# Altium schematic sheet Altium_Schematic.schdoc (part 4 of 6)
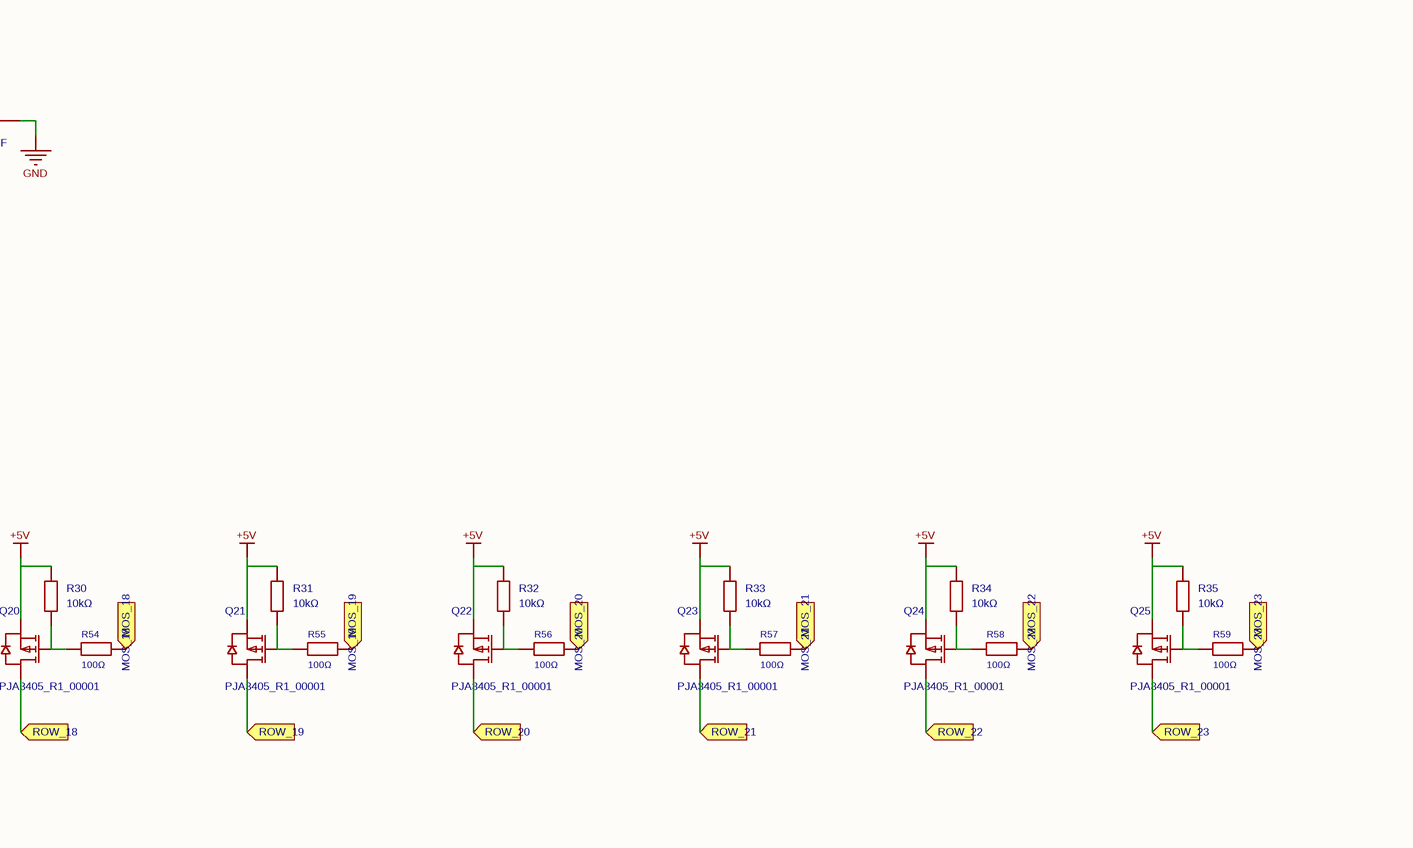
[diagram p14: Altium_Schematic.schdoc, bottom column 4 of 4]

## Parts (continued)
LED1572  16-213/BHC-AN1P2/3T  [LED0402-R-RD]  (value not drawn)
LED1573  16-213/BHC-AN1P2/3T  [LED0402-R-RD]  (value not drawn)
LED1574  16-213/BHC-AN1P2/3T  [LED0402-R-RD]  (value not drawn)
LED1575  16-213/BHC-AN1P2/3T  [LED0402-R-RD]  (value not drawn)
LED1576  16-213/BHC-AN1P2/3T  [LED0402-R-RD]  (value not drawn)
LED1577  16-213/BHC-AN1P2/3T  [LED0402-R-RD]  (value not drawn)
LED1578  16-213/BHC-AN1P2/3T  [LED0402-R-RD]  (value not drawn)
LED1579  16-213/BHC-AN1P2/3T  [LED0402-R-RD]  (value not drawn)
LED1580  16-213/BHC-AN1P2/3T  [LED0402-R-RD]  (value not drawn)
LED1581  16-213/BHC-AN1P2/3T  [LED0402-R-RD]  (value not drawn)
LED1582  16-213/BHC-AN1P2/3T  [LED0402-R-RD]  (value not drawn)
LED1583  16-213/BHC-AN1P2/3T  [LED0402-R-RD]  (value not drawn)
LED1584  16-213/BHC-AN1P2/3T  [LED0402-R-RD]  (value not drawn)
LED1585  16-213/BHC-AN1P2/3T  [LED0402-R-RD]  (value not drawn)
LED1586  16-213/BHC-AN1P2/3T  [LED0402-R-RD]  (value not drawn)
LED1587  16-213/BHC-AN1P2/3T  [LED0402-R-RD]  (value not drawn)
LED1588  16-213/BHC-AN1P2/3T  [LED0402-R-RD]  (value not drawn)
LED1589  16-213/BHC-AN1P2/3T  [LED0402-R-RD]  (value not drawn)
LED1590  16-213/BHC-AN1P2/3T  [LED0402-R-RD]  (value not drawn)
LED1591  16-213/BHC-AN1P2/3T  [LED0402-R-RD]  (value not drawn)
LED1592  16-213/BHC-AN1P2/3T  [LED0402-R-RD]  (value not drawn)
LED1593  16-213/BHC-AN1P2/3T  [LED0402-R-RD]  (value not drawn)
LED1594  16-213/BHC-AN1P2/3T  [LED0402-R-RD]  (value not drawn)
LED1595  16-213/BHC-AN1P2/3T  [LED0402-R-RD]  (value not drawn)
LED1596  16-213/BHC-AN1P2/3T  [LED0402-R-RD]  (value not drawn)
LED1597  16-213/BHC-AN1P2/3T  [LED0402-R-RD]  (value not drawn)
LED1598  16-213/BHC-AN1P2/3T  [LED0402-R-RD]  (value not drawn)
LED1599  16-213/BHC-AN1P2/3T  [LED0402-R-RD]  (value not drawn)
LED1600  16-213/BHC-AN1P2/3T  [LED0402-R-RD]  (value not drawn)
LED1601  16-213/BHC-AN1P2/3T  [LED0402-R-RD]  (value not drawn)
LED1602  16-213/BHC-AN1P2/3T  [LED0402-R-RD]  (value not drawn)
LED1603  16-213/BHC-AN1P2/3T  [LED0402-R-RD]  (value not drawn)
LED1604  16-213/BHC-AN1P2/3T  [LED0402-R-RD]  (value not drawn)
LED1605  16-213/BHC-AN1P2/3T  [LED0402-R-RD]  (value not drawn)
LED1606  16-213/BHC-AN1P2/3T  [LED0402-R-RD]  (value not drawn)
LED1607  16-213/BHC-AN1P2/3T  [LED0402-R-RD]  (value not drawn)
LED1608  16-213/BHC-AN1P2/3T  [LED0402-R-RD]  (value not drawn)
LED1609  16-213/BHC-AN1P2/3T  [LED0402-R-RD]  (value not drawn)
LED1610  16-213/BHC-AN1P2/3T  [LED0402-R-RD]  (value not drawn)
LED1611  16-213/BHC-AN1P2/3T  [LED0402-R-RD]  (value not drawn)
LED1612  16-213/BHC-AN1P2/3T  [LED0402-R-RD]  (value not drawn)
LED1613  16-213/BHC-AN1P2/3T  [LED0402-R-RD]  (value not drawn)
LED1614  16-213/BHC-AN1P2/3T  [LED0402-R-RD]  (value not drawn)
LED1615  16-213/BHC-AN1P2/3T  [LED0402-R-RD]  (value not drawn)
LED1616  16-213/BHC-AN1P2/3T  [LED0402-R-RD]  (value not drawn)
LED1617  16-213/BHC-AN1P2/3T  [LED0402-R-RD]  (value not drawn)
LED1618  16-213/BHC-AN1P2/3T  [LED0402-R-RD]  (value not drawn)
LED1619  16-213/BHC-AN1P2/3T  [LED0402-R-RD]  (value not drawn)
LED1620  16-213/BHC-AN1P2/3T  [LED0402-R-RD]  (value not drawn)
LED1621  16-213/BHC-AN1P2/3T  [LED0402-R-RD]  (value not drawn)
LED1622  16-213/BHC-AN1P2/3T  [LED0402-R-RD]  (value not drawn)
LED1623  16-213/BHC-AN1P2/3T  [LED0402-R-RD]  (value not drawn)
LED1624  16-213/BHC-AN1P2/3T  [LED0402-R-RD]  (value not drawn)
LED1625  16-213/BHC-AN1P2/3T  [LED0402-R-RD]  (value not drawn)
LED1626  16-213/BHC-AN1P2/3T  [LED0402-R-RD]  (value not drawn)
LED1627  16-213/BHC-AN1P2/3T  [LED0402-R-RD]  (value not drawn)
LED1628  16-213/BHC-AN1P2/3T  [LED0402-R-RD]  (value not drawn)
LED1629  16-213/BHC-AN1P2/3T  [LED0402-R-RD]  (value not drawn)
LED1630  16-213/BHC-AN1P2/3T  [LED0402-R-RD]  (value not drawn)
LED1631  16-213/BHC-AN1P2/3T  [LED0402-R-RD]  (value not drawn)
LED1632  16-213/BHC-AN1P2/3T  [LED0402-R-RD]  (value not drawn)
LED1633  16-213/BHC-AN1P2/3T  [LED0402-R-RD]  (value not drawn)
LED1634  16-213/BHC-AN1P2/3T  [LED0402-R-RD]  (value not drawn)
LED1635  16-213/BHC-AN1P2/3T  [LED0402-R-RD]  (value not drawn)
LED1636  16-213/BHC-AN1P2/3T  [LED0402-R-RD]  (value not drawn)
LED1637  16-213/BHC-AN1P2/3T  [LED0402-R-RD]  (value not drawn)
LED1638  16-213/BHC-AN1P2/3T  [LED0402-R-RD]  (value not drawn)
LED1639  16-213/BHC-AN1P2/3T  [LED0402-R-RD]  (value not drawn)
LED1640  16-213/BHC-AN1P2/3T  [LED0402-R-RD]  (value not drawn)
LED1641  16-213/BHC-AN1P2/3T  [LED0402-R-RD]  (value not drawn)
LED1642  16-213/BHC-AN1P2/3T  [LED0402-R-RD]  (value not drawn)
LED1643  16-213/BHC-AN1P2/3T  [LED0402-R-RD]  (value not drawn)
LED1644  16-213/BHC-AN1P2/3T  [LED0402-R-RD]  (value not drawn)
LED1645  16-213/BHC-AN1P2/3T  [LED0402-R-RD]  (value not drawn)
LED1646  16-213/BHC-AN1P2/3T  [LED0402-R-RD]  (value not drawn)
LED1647  16-213/BHC-AN1P2/3T  [LED0402-R-RD]  (value not drawn)
LED1648  16-213/BHC-AN1P2/3T  [LED0402-R-RD]  (value not drawn)
LED1649  16-213/BHC-AN1P2/3T  [LED0402-R-RD]  (value not drawn)
LED1650  16-213/BHC-AN1P2/3T  [LED0402-R-RD]  (value not drawn)
LED1651  16-213/BHC-AN1P2/3T  [LED0402-R-RD]  (value not drawn)
LED1652  16-213/BHC-AN1P2/3T  [LED0402-R-RD]  (value not drawn)
LED1653  16-213/BHC-AN1P2/3T  [LED0402-R-RD]  (value not drawn)
LED1654  16-213/BHC-AN1P2/3T  [LED0402-R-RD]  (value not drawn)
LED1655  16-213/BHC-AN1P2/3T  [LED0402-R-RD]  (value not drawn)
LED1656  16-213/BHC-AN1P2/3T  [LED0402-R-RD]  (value not drawn)
LED1657  16-213/BHC-AN1P2/3T  [LED0402-R-RD]  (value not drawn)
LED1658  16-213/BHC-AN1P2/3T  [LED0402-R-RD]  (value not drawn)
LED1659  16-213/BHC-AN1P2/3T  [LED0402-R-RD]  (value not drawn)
LED1660  16-213/BHC-AN1P2/3T  [LED0402-R-RD]  (value not drawn)
LED1661  16-213/BHC-AN1P2/3T  [LED0402-R-RD]  (value not drawn)
LED1662  16-213/BHC-AN1P2/3T  [LED0402-R-RD]  (value not drawn)
LED1663  16-213/BHC-AN1P2/3T  [LED0402-R-RD]  (value not drawn)
LED1664  16-213/BHC-AN1P2/3T  [LED0402-R-RD]  (value not drawn)
LED1665  16-213/BHC-AN1P2/3T  [LED0402-R-RD]  (value not drawn)
LED1666  16-213/BHC-AN1P2/3T  [LED0402-R-RD]  (value not drawn)
LED1667  16-213/BHC-AN1P2/3T  [LED0402-R-RD]  (value not drawn)
LED1668  16-213/BHC-AN1P2/3T  [LED0402-R-RD]  (value not drawn)
LED1669  16-213/BHC-AN1P2/3T  [LED0402-R-RD]  (value not drawn)
LED1670  16-213/BHC-AN1P2/3T  [LED0402-R-RD]  (value not drawn)
LED1671  16-213/BHC-AN1P2/3T  [LED0402-R-RD]  (value not drawn)
LED1672  16-213/BHC-AN1P2/3T  [LED0402-R-RD]  (value not drawn)
LED1673  16-213/BHC-AN1P2/3T  [LED0402-R-RD]  (value not drawn)
LED1674  16-213/BHC-AN1P2/3T  [LED0402-R-RD]  (value not drawn)
LED1675  16-213/BHC-AN1P2/3T  [LED0402-R-RD]  (value not drawn)
LED1676  16-213/BHC-AN1P2/3T  [LED0402-R-RD]  (value not drawn)
LED1677  16-213/BHC-AN1P2/3T  [LED0402-R-RD]  (value not drawn)
LED1678  16-213/BHC-AN1P2/3T  [LED0402-R-RD]  (value not drawn)
LED1679  16-213/BHC-AN1P2/3T  [LED0402-R-RD]  (value not drawn)
LED1680  16-213/BHC-AN1P2/3T  [LED0402-R-RD]  (value not drawn)
LED1681  16-213/BHC-AN1P2/3T  [LED0402-R-RD]  (value not drawn)
LED1682  16-213/BHC-AN1P2/3T  [LED0402-R-RD]  (value not drawn)
LED1683  16-213/BHC-AN1P2/3T  [LED0402-R-RD]  (value not drawn)
LED1684  16-213/BHC-AN1P2/3T  [LED0402-R-RD]  (value not drawn)
LED1685  16-213/BHC-AN1P2/3T  [LED0402-R-RD]  (value not drawn)
LED1686  16-213/BHC-AN1P2/3T  [LED0402-R-RD]  (value not drawn)
LED1687  16-213/BHC-AN1P2/3T  [LED0402-R-RD]  (value not drawn)
LED1688  16-213/BHC-AN1P2/3T  [LED0402-R-RD]  (value not drawn)
LED1689  16-213/BHC-AN1P2/3T  [LED0402-R-RD]  (value not drawn)
LED1690  16-213/BHC-AN1P2/3T  [LED0402-R-RD]  (value not drawn)
LED1691  16-213/BHC-AN1P2/3T  [LED0402-R-RD]  (value not drawn)
LED1692  16-213/BHC-AN1P2/3T  [LED0402-R-RD]  (value not drawn)
LED1693  16-213/BHC-AN1P2/3T  [LED0402-R-RD]  (value not drawn)
LED1694  16-213/BHC-AN1P2/3T  [LED0402-R-RD]  (value not drawn)
LED1695  16-213/BHC-AN1P2/3T  [LED0402-R-RD]  (value not drawn)
LED1696  16-213/BHC-AN1P2/3T  [LED0402-R-RD]  (value not drawn)
LED1697  16-213/BHC-AN1P2/3T  [LED0402-R-RD]  (value not drawn)
LED1698  16-213/BHC-AN1P2/3T  [LED0402-R-RD]  (value not drawn)
LED1699  16-213/BHC-AN1P2/3T  [LED0402-R-RD]  (value not drawn)
LED1700  16-213/BHC-AN1P2/3T  [LED0402-R-RD]  (value not drawn)
LED1701  16-213/BHC-AN1P2/3T  [LED0402-R-RD]  (value not drawn)
LED1702  16-213/BHC-AN1P2/3T  [LED0402-R-RD]  (value not drawn)
LED1703  16-213/BHC-AN1P2/3T  [LED0402-R-RD]  (value not drawn)
LED1704  16-213/BHC-AN1P2/3T  [LED0402-R-RD]  (value not drawn)
LED1705  16-213/BHC-AN1P2/3T  [LED0402-R-RD]  (value not drawn)
LED1706  16-213/BHC-AN1P2/3T  [LED0402-R-RD]  (value not drawn)
LED1707  16-213/BHC-AN1P2/3T  [LED0402-R-RD]  (value not drawn)
LED1708  16-213/BHC-AN1P2/3T  [LED0402-R-RD]  (value not drawn)
LED1709  16-213/BHC-AN1P2/3T  [LED0402-R-RD]  (value not drawn)
LED1710  16-213/BHC-AN1P2/3T  [LED0402-R-RD]  (value not drawn)
LED1711  16-213/BHC-AN1P2/3T  [LED0402-R-RD]  (value not drawn)
LED1712  16-213/BHC-AN1P2/3T  [LED0402-R-RD]  (value not drawn)
LED1713  16-213/BHC-AN1P2/3T  [LED0402-R-RD]  (value not drawn)
LED1714  16-213/BHC-AN1P2/3T  [LED0402-R-RD]  (value not drawn)
LED1715  16-213/BHC-AN1P2/3T  [LED0402-R-RD]  (value not drawn)
LED1716  16-213/BHC-AN1P2/3T  [LED0402-R-RD]  (value not drawn)
LED1717  16-213/BHC-AN1P2/3T  [LED0402-R-RD]  (value not drawn)
LED1718  16-213/BHC-AN1P2/3T  [LED0402-R-RD]  (value not drawn)
LED1719  16-213/BHC-AN1P2/3T  [LED0402-R-RD]  (value not drawn)
LED1720  16-213/BHC-AN1P2/3T  [LED0402-R-RD]  (value not drawn)
LED1721  16-213/BHC-AN1P2/3T  [LED0402-R-RD]  (value not drawn)
LED1722  16-213/BHC-AN1P2/3T  [LED0402-R-RD]  (value not drawn)
LED1723  16-213/BHC-AN1P2/3T  [LED0402-R-RD]  (value not drawn)
LED1724  16-213/BHC-AN1P2/3T  [LED0402-R-RD]  (value not drawn)
LED1725  16-213/BHC-AN1P2/3T  [LED0402-R-RD]  (value not drawn)
LED1726  16-213/BHC-AN1P2/3T  [LED0402-R-RD]  (value not drawn)
LED1727  16-213/BHC-AN1P2/3T  [LED0402-R-RD]  (value not drawn)
LED1728  16-213/BHC-AN1P2/3T  [LED0402-R-RD]  (value not drawn)
Q1  2N7002ET1G  [SOT-23-3_L2.9-W1.6-P1.90-LS2.8-BR]
Q2  PJA3405_R1_00001  [SOT-23_L2.9-W1.3-P1.90-LS2.4-BR]
Q3  PJA3405_R1_00001  [SOT-23_L2.9-W1.3-P1.90-LS2.4-BR]
Q4  PJA3405_R1_00001  [SOT-23_L2.9-W1.3-P1.90-LS2.4-BR]
Q5  PJA3405_R1_00001  [SOT-23_L2.9-W1.3-P1.90-LS2.4-BR]
Q6  PJA3405_R1_00001  [SOT-23_L2.9-W1.3-P1.90-LS2.4-BR]
Q7  PJA3405_R1_00001  [SOT-23_L2.9-W1.3-P1.90-LS2.4-BR]
Q8  PJA3405_R1_00001  [SOT-23_L2.9-W1.3-P1.90-LS2.4-BR]
Q9  PJA3405_R1_00001  [SOT-23_L2.9-W1.3-P1.90-LS2.4-BR]
Q10  PJA3405_R1_00001  [SOT-23_L2.9-W1.3-P1.90-LS2.4-BR]
Q11  PJA3405_R1_00001  [SOT-23_L2.9-W1.3-P1.90-LS2.4-BR]
Q12  PJA3405_R1_00001  [SOT-23_L2.9-W1.3-P1.90-LS2.4-BR]
Q13  PJA3405_R1_00001  [SOT-23_L2.9-W1.3-P1.90-LS2.4-BR]
Q14  PJA3405_R1_00001  [SOT-23_L2.9-W1.3-P1.90-LS2.4-BR]
Q15  PJA3405_R1_00001  [SOT-23_L2.9-W1.3-P1.90-LS2.4-BR]
Q16  PJA3405_R1_00001  [SOT-23_L2.9-W1.3-P1.90-LS2.4-BR]
Q17  PJA3405_R1_00001  [SOT-23_L2.9-W1.3-P1.90-LS2.4-BR]
Q18  PJA3405_R1_00001  [SOT-23_L2.9-W1.3-P1.90-LS2.4-BR]
Q19  PJA3405_R1_00001  [SOT-23_L2.9-W1.3-P1.90-LS2.4-BR]
Q20  PJA3405_R1_00001  [SOT-23_L2.9-W1.3-P1.90-LS2.4-BR]
Q21  PJA3405_R1_00001  [SOT-23_L2.9-W1.3-P1.90-LS2.4-BR]
Q22  PJA3405_R1_00001  [SOT-23_L2.9-W1.3-P1.90-LS2.4-BR]
Q23  PJA3405_R1_00001  [SOT-23_L2.9-W1.3-P1.90-LS2.4-BR]
Q24  PJA3405_R1_00001  [SOT-23_L2.9-W1.3-P1.90-LS2.4-BR]
Q25  PJA3405_R1_00001  [SOT-23_L2.9-W1.3-P1.90-LS2.4-BR]
R1  10kΩ  [R0402]
R2  10kΩ  [R0402]
R3  10kΩ  [R0402]
R4  10kΩ  [R0402]
R5  10kΩ  [R0402]
R6  10kΩ  [R0402]
R7  10kΩ  [R0402]
R8  10kΩ  [R0402]
R9  10kΩ  [R0402]
R10  100Ω  [R0402]
R11  10kΩ  [R0402]
R12  10kΩ  [R0402]
R13  10kΩ  [R0402]
R14  10kΩ  [R0402]
R15  10kΩ  [R0402]
R16  10kΩ  [R0402]
R17  10kΩ  [R0402]
R18  10kΩ  [R0402]
R19  10kΩ  [R0402]
R20  10kΩ  [R0402]
R21  10kΩ  [R0402]
R22  10kΩ  [R0402]
R23  10kΩ  [R0402]
R24  10kΩ  [R0402]
R25  10kΩ  [R0402]
R26  10kΩ  [R0402]
R27  10kΩ  [R0402]
R28  10kΩ  [R0402]
R29  10kΩ  [R0402]
R30  10kΩ  [R0402]
R31  10kΩ  [R0402]
R32  10kΩ  [R0402]
R33  10kΩ  [R0402]
R34  10kΩ  [R0402]
R35  10kΩ  [R0402]
R36  100Ω  [R0402]
R37  100Ω  [R0402]
R38  100Ω  [R0402]
R39  100Ω  [R0402]
R40  100Ω  [R0402]
R41  100Ω  [R0402]
R42  100Ω  [R0402]
R43  100Ω  [R0402]
R44  100Ω  [R0402]
R45  100Ω  [R0402]
R46  100Ω  [R0402]
R47  100Ω  [R0402]
R48  100Ω  [R0402]
R49  100Ω  [R0402]
R50  100Ω  [R0402]
R51  100Ω  [R0402]
R52  100Ω  [R0402]
R53  100Ω  [R0402]
R54  100Ω  [R0402]
R55  100Ω  [R0402]
R56  100Ω  [R0402]
R57  100Ω  [R0402]
R58  100Ω  [R0402]
R59  100Ω  [R0402]
R60  5.1kΩ  [R0402]
R61  5.1kΩ  [R0402]
SW1  SKPMDAE011  [SW-SMD_L6.0-W6.0-LS6.6]
U1  TLC59282DBQR  [SSOP-24_L8.8-W4.0-P0.64-LS6.2-BL]
U2  TLC59282DBQR  [SSOP-24_L8.8-W4.0-P0.64-LS6.2-BL]
U3  TLC59282DBQR  [SSOP-24_L8.8-W4.0-P0.64-LS6.2-BL]
U4  TLC59282DBQR  [SSOP-24_L8.8-W4.0-P0.64-LS6.2-BL]
U5  TLC59282DBQR  [SSOP-24_L8.8-W4.0-P0.64-LS6.2-BL]
U6  ESP32-C3-MINI-1-N4  [WIFIM-SMD_ESP32-C3-MINI-1]
U7  74HCT595BQ,115  [DHVQFN-16_L3.5-W2.5-P0.50-BL-EP]
U8  74HCT595BQ,115  [DHVQFN-16_L3.5-W2.5-P0.50-BL-EP]
U9  74HCT595BQ,115  [DHVQFN-16_L3.5-W2.5-P0.50-BL-EP]
U10  AMS1117-3.3  [SOT-223-3_L6.5-W3.4-P2.30-LS7.0-BR]
USB1  TYPE-C 16PIN 2MD(073)  [USB-C-SMD_TYPE-C-16PIN-2MD-073]

## Ports
COLUMN_0 (in), COLUMN_1 (in), COLUMN_2 (in), COLUMN_3 (in), COLUMN_4 (in), COLUMN_5 (in), COLUMN_6 (in), COLUMN_7 (in), COLUMN_8 (in), COLUMN_9 (in), COLUMN_10 (in), COLUMN_11 (in), COLUMN_12 (in), COLUMN_13 (in), COLUMN_14 (in), COLUMN_15 (in), COLUMN_16 (in), COLUMN_17 (in), COLUMN_18 (in), COLUMN_19 (in), COLUMN_20 (in), COLUMN_21 (in), COLUMN_22 (in), COLUMN_23 (in), COLUMN_24 (in), COLUMN_25 (in), COLUMN_26 (in), COLUMN_27 (in), COLUMN_28 (in), COLUMN_29 (in), COLUMN_30 (in), COLUMN_31 (in), COLUMN_32 (in), COLUMN_33 (in), COLUMN_34 (in), COLUMN_35 (in), COLUMN_36 (in), COLUMN_37 (in), COLUMN_38 (in), COLUMN_39 (in), COLUMN_40 (in), COLUMN_41 (in), COLUMN_42 (in), COLUMN_43 (in), COLUMN_44 (in), COLUMN_45 (in), COLUMN_46 (in), COLUMN_47 (in), COLUMN_48 (in), COLUMN_49 (in), COLUMN_50 (in), COLUMN_51 (in), COLUMN_52 (in), COLUMN_53 (in), COLUMN_54 (in), COLUMN_55 (in), COLUMN_56 (in), COLUMN_57 (in), COLUMN_58 (in), COLUMN_59 (in), COLUMN_60 (in), COLUMN_61 (in), COLUMN_62 (in), COLUMN_63 (in), COLUMN_64 (in), COLUMN_65 (in), COLUMN_66 (in), COLUMN_67 (in), COLUMN_68 (in), COLUMN_69 (in), COLUMN_70 (in), COLUMN_71 (in), COLUMN_BLANK (in), COLUMN_LATCH (in), D+ (in), D- (in), MOS_0 (in), MOS_1 (in), MOS_2 (in), MOS_3 (in), MOS_4 (in), MOS_5 (in), MOS_6 (in), MOS_7 (in), MOS_8 (in), MOS_9 (in), MOS_10 (in), MOS_11 (in), MOS_12 (in), MOS_13 (in), MOS_14 (in), MOS_15 (in), MOS_16 (in), MOS_17 (in), MOS_18 (in), MOS_19 (in), MOS_20 (in), MOS_21 (in), MOS_22 (in), MOS_23 (in), R_MOSI_OUT_1 (in), R_MOSI_OUT_2 (in), ROW_0 (in), ROW_1 (in), ROW_2 (in), ROW_3 (in), ROW_4 (in), ROW_5 (in), ROW_6 (in), ROW_7 (in), ROW_8 (in), ROW_9 (in), ROW_10 (in), ROW_11 (in), ROW_12 (in), ROW_13 (in), ROW_14 (in), ROW_15 (in), ROW_16 (in), ROW_17 (in), ROW_18 (in), ROW_19 (in), ROW_20 (in), ROW_21 (in), ROW_22 (in), ROW_23 (in), ROW_EN_OUT (in), ROW_LATCH (in), ROW_OE (in), SOUT_1 (in), SOUT_2 (in), SOUT_3 (in), SOUT_4 (in), SPI_MOSI (in), SPI_SCLK (in), UNFILTERED_D+ (in), UNFILTERED_D- (in)